# Altium project Space_Battery_Test.PrjPcb
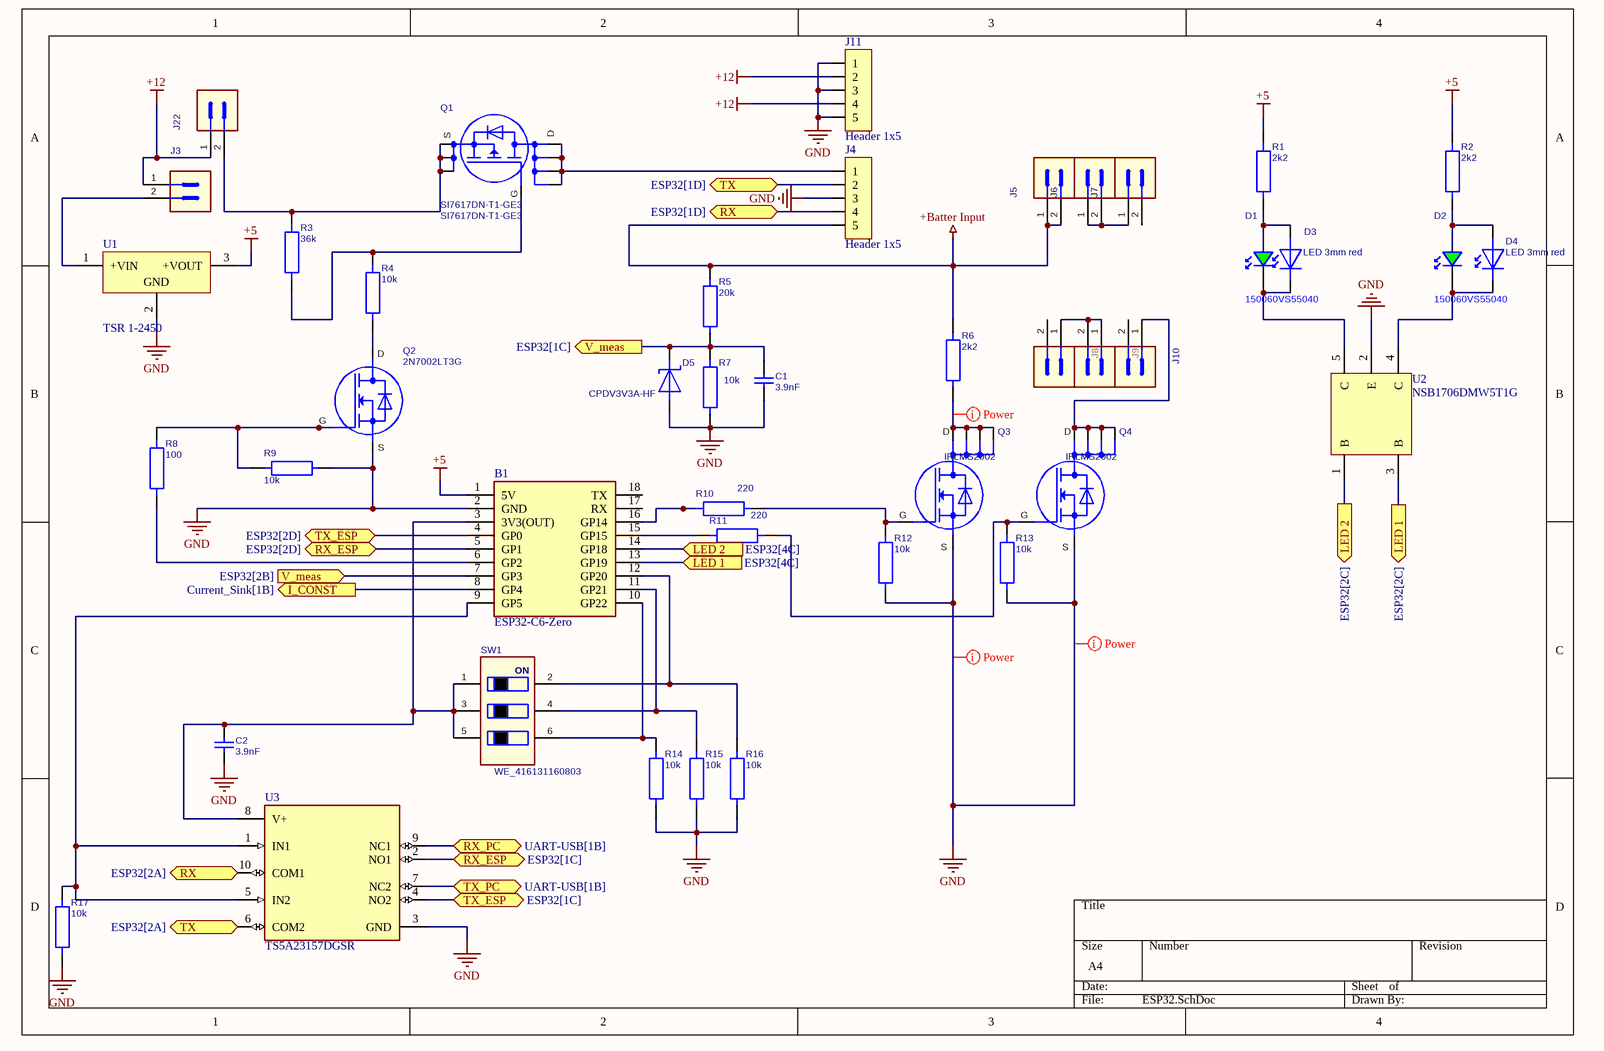
[diagram p0: ESP32.SchDoc, left]
3 sheets, 59 parts. Net scope: flat (ports and power ports of the same name join across sheets).
Board file: Space_Test_Battery.PcbDoc
Sheets:
  ESP32.SchDoc
  UART-USB.SchDoc
  Current_Sink.SchDoc

## Sheet ESP32.SchDoc
size A4; SheetNumber: 1; SheetTotal: 3

### Parts
B1  ESP32-C6-Zero  [ESP32C6Zero]
C1  3.9nF  [CAP0805H1520]
C2  3.9nF  [CAP0805H1520]
D1  150060VS55040  [LEDC160X75X41L40-green(WE)]
D2  150060VS55040  [LEDC160X75X41L40-green(WE)]
D3  LED 3mm red  [LED_THT_3mm]
D4  LED 3mm red  [LED_THT_3mm]
D5  CPDV3V3A-HF  [SOD882]
J3  5-825433-0_2/50  [PIN_HEADER_2_54mm_1_1mm_1x2]  (value not drawn)
J4  Header 1x5  [Header 1x5 2.54mm]
J5  5-825433-0_2/50  [PIN_HEADER_2_54mm_1_1mm_1x2]  (value not drawn)
J6  5-825433-0_2/50  [PIN_HEADER_2_54mm_1_1mm_1x2]  (value not drawn)
J7  5-825433-0_2/50  [PIN_HEADER_2_54mm_1_1mm_1x2]  (value not drawn)
J8  5-825433-0_2/50  [PIN_HEADER_2_54mm_1_1mm_1x2]  (value not drawn)
J9  5-825433-0_2/50  [PIN_HEADER_2_54mm_1_1mm_1x2]  (value not drawn)
J10  5-825433-0_2/50  [PIN_HEADER_2_54mm_1_1mm_1x2]  (value not drawn)
J11  Header 1x5  [Header 1x5 2.54mm]
J22  5-825433-0_2/50  [PIN_HEADER_2_54mm_1_1mm_1x2]  (value not drawn)
Q1  SI7617DN-T1-GE3  [PowerPAK1212-8]
Q2  2N7002LT3G  [SOT23]
Q3  IRLMS2002  [SOT23-6]
Q4  IRLMS2002  [SOT23-6]
R1  2k2  [RES0805MD]
R2  2k2  [RES0805MD]
R3  36k  [RES0805MD]
R4  10k  [RES0805MD]
R5  20k  [RES0805MD]
R6  2k2  [RES0805MD]
R7  10k  [RES0805MD]
R8  100  [RES0805MD]
R9  10k  [RES0805MD]
R10  220  [RES0805MD]
R11  220  [RES0805MD]
R12  10k  [RES0805MD]
R13  10k  [RES0805MD]
R14  10k  [RES0805MD]
R15  10k  [RES0805MD]
R16  10k  [RES0805MD]
R17  10k  [RES0805MD]
SW1  WE_416131160803  [WE_416131160803]
U1  TSR 1-2450  [TRACO-SIP-3_V]
U2  NSB1706DMW5T1G  [ONSC-SC70-5-419A-02_V]
U3  TS5A23157DGSR  [FP-DGS0010A-IPC_C]

### Ports
I_CONST (out, see Current_Sink[1B]), LED 1 (in, see ESP32[4C]), LED 1 (out, see ESP32[2C]), LED 2 (in, see ESP32[4C]), LED 2 (out, see ESP32[2C]), RX (bidir, see ESP32[1D]), RX (bidir, see ESP32[2A]), RX_ESP (bidir, see ESP32[1C]), RX_ESP (bidir, see ESP32[2D]), RX_PC (bidir, see UART-USB[1B]), TX (bidir, see ESP32[1D]), TX (bidir, see ESP32[2A]), TX_ESP (bidir, see ESP32[1C]), TX_ESP (bidir, see ESP32[2D]), TX_PC (bidir, see UART-USB[1B]), V_meas (in, see ESP32[2B]), V_meas (out, see ESP32[1C])

### Nets
+5: B1.1(5V) R1.2 R2.2 U1.3(+VOUT)
+12: J3.1 J11.2 J11.4 J22.1
+Batter Input: J4.5 J5.1 J5.2 R5.2 R6.1
GND: B1.2(GND) C1.1 C2.1 D5.2(A) J4.3 J11.1 J11.3 J11.5 Q2.2(S) Q3.4(S) Q4.4(S) R7.1 R9.1 R12.1 R13.1 R14.2 R15.2 R16.2 R17.2 U1.2(GND) U2.2(E) U3.3(GND)
NetB1_3: B1.3(3V3(OUT)) C2.2 SW1.1 SW1.3 SW1.5 U3.8(V+)
NetB1_4: B1.4(GP0) U3.4(NO2) ; port TX_ESP
NetB1_5: B1.5(GP1) U3.2(NO1) ; port RX_ESP
NetB1_6: B1.6(GP2) R8.1
NetB1_7: B1.7(GP3) C1.2 D5.1(K) R5.1 R7.2 ; port V_meas
NetB1_8: B1.8(GP4) ; port I_CONST
NetB1_9: B1.9(GP5) R17.1 U3.1(IN1) U3.5(IN2)
NetB1_10: B1.10(GP22) R14.1 SW1.6
NetB1_11: B1.11(GP21) R15.1 SW1.4
NetB1_12: B1.12(GP20) R16.1 SW1.2
NetB1_13: B1.13(GP19) U2.3(B) ; port LED 1
NetB1_14: B1.14(GP18) U2.1(B) ; port LED 2
NetB1_15: B1.15(GP15) R11.1
NetB1_16: B1.16(GP14) R10.1
NetD1_1: D1.1(K) D3.2(K) U2.5(C)
NetD1_2: D1.2(A) D3.1(A) R1.1
NetD2_1: D2.1(K) D4.2(K) U2.4(C)
NetD2_2: D2.2(A) D4.1(A) R2.1
NetJ3_2: J3.2 U1.1(+VIN)
NetJ4_1: J4.1 Q1.5(D) Q1.6(D) Q1.7(D) Q1.8(D)
NetJ4_2: J4.2 U3.6(COM2) ; port TX
NetJ4_4: J4.4 U3.10(COM1) ; port RX
NetJ6_1: J6.1 J6.2 J7.1
NetJ8_1: J8.1 J9.1 J9.2
NetJ10_1: J10.1 Q4.1(D) Q4.2(D) Q4.5(D) Q4.6(D)
NetJ12_1: U3.9(NC1) ; port RX_PC
NetJ13_1: U3.7(NC2) ; port TX_PC
NetJ22_2: J22.2 Q1.1(S) Q1.2(S) Q1.3(S) R3.2
NetQ1_4: Q1.4(G) R3.1 R4.1
NetQ2_1: Q2.1(G) R8.2 R9.2
NetQ2_3: Q2.3(D) R4.2
NetQ3_1: Q3.1(D) Q3.2(D) Q3.5(D) Q3.6(D) R6.2
NetQ3_3: Q3.3(G) R10.2 R12.2
NetQ4_3: Q4.3(G) R11.2 R13.2

Not connected (* = marked no-connect by the designer): B1 17(RX) 18(TX); J7 2; J8 2; J10 2

### Layout directives
net class Power: GND, NetQ3_1

### Notes on the sheet
- (in symbol UID-1051BDF3C131CE8C09EA) ON

### Library data of the parts
B1 = ESP32-C6-Zero: ESP32-C6 Mini Development Board, Based on ESP32-C6FH4, Dual Processors, 160MHz Running Frequency, 2.4GHz WiFi 6 & Bluetooth 5, ESP32 Development Board; Manufacturer_Name: Waveshare; Geometry.Height: 5.5mm; Manufacturer_Part_Number: ESP32-C6-Zero; Mouser Part Number: *; Mouser Price/Stock: *; Arrow Part Number: *; Arrow Price/Stock: *; Datasheet Link: https://www.waveshare.com/esp32-c6-zero.htm
C1 C2 = UID-1DC189D77836E3ADB330: CAP 3.9nF 5% C0G 50V; SAP-Partnumber: 35031280; Manufacturer Part Number: 08055A392JAT2A; Manufacturer: KYOCERA AVX; Compliance: RoHS2; Temperature - Rated: -55 °C to +125 °C; Reviewer: hoersede; Library Status: Production; uid: UID-1DC189D77836E3ADB330; partid: 60; Category: Ceramic; ComponentLink1Description: Datasheet; ComponentLink1URL: https://code.bbraun.io/BA-RD-EE/altium-partlib/raw/main/components/datasheets/35031280_SMD_KOND-KER_3,9NF_5Proz_50V_C0G_0805/AVX_datasheet_C0GNP0-Dielectric.pdf; ComponentLink2Description: Compliance Certificate; ComponentLink2URL: https://code.bbraun.io/BA-RD-EE/altium-partlib/raw/main/components/datasheets/35031280_SMD_KOND-KER_3,9NF_5Proz_50V_C0G_0805/AVX_datasheet_C0GNP0-Dielectric.pdf; ComponentLink3Description: Datasheet Folder; ComponentLink3URL: https://code.bbraun.io/BA-RD-EE/altium-partlib/raw/main/components/datasheets/35031280_SMD_KOND-KER_3,9NF_5Proz_50V_C0G_0805/; ComponentLink4Description: Data Sheet Library; ComponentLink4URL: http://ais.development.bbraun.com/dsl/35031280; Supplier 1: Mouser; Supplier 2: Digikey; Supplier 3: RS Components; Supplier 4: Farnell; Value: 3.9nF; Tolerance: 5%; Maximum Height: 1.52 mm; Package / Case: 0805; Technology: SMT; Type: C0G; Price@1k: 0,01183 €; Voltage - Rated: 50V; Creator: weirmade; Creation Date: 22.05.2023; Last Updated: 22.05.2023; Review Date: 07.06.2025; Lifecycle Status: Active
D1 D2 = UID-108CCBCADD5F52F6FAD1: Led Green 0603 SMD; SAP-Partnumber: 35146000; Manufacturer: Würth Elektronik; Compliance: RoHS; Current Rated: 20mA; Voltage - Rated: 2.4V; Temperature - Rated: -40 °C to +85 °C; Remark: NGX; Reviewer: hoersede; Library Status: Prototype; uid: UID-108CCBCADD5F52F6FAD1; partid: 61; Category: LED; Manufacturer Part Number: 150060VS55040; ComponentLink1Description: Datasheet; ComponentLink1URL: https://code.bbraun.io/BA-RD-EE/altium-partlib/raw/main/components/datasheets/35146000_SMD_LED-Green_0603/35146000_Wuerth_150060VS55040_Datasheet.pdf; ComponentLink2Description: Compliance Certificate; ComponentLink2URL: https://code.bbraun.io/BA-RD-EE/altium-partlib/raw/main/components/datasheets/35146000_SMD_LED-Green_0603/35146000_Wuerth_150060VS55040_ROHS_REACH.pdf; ComponentLink3Description: Datasheet Folder; ComponentLink3URL: https://code.bbraun.io/BA-RD-EE/altium-partlib/raw/main/components/datasheets/35146000_SMD_LED-Green_0603/; ComponentLink4Description: Data Sheet Library; ComponentLink4URL: http://ais.development.bbraun.com/dsl/35146000; Supplier Part Number 1: 710-150060VS55040; Supplier Part Number 2: 732-12017-2-ND; Supplier Part Number 3: 1766157; Supplier Part Number 4: 2900765RL; Supplier 1: Mouser; Supplier 2: Digikey; Supplier 3: RS Components; Supplier 4: Farnell; Maximum Height: 0.5 mm; Package / Case: 0603; Technology: SMT; Price@1k: 0,033 €; Creator: GEG DF,GK; Creation Date: 21.05.2022; Last Updated: 15.01.2026; Review Date: 08.06.2025; Lifecycle Status: Active
D3 D4 = UID-E12BBC48C07D2EA352E9: LED Red, 625 nm, GaAsP/GaP, THT, 3mm; Manufacturer Part Number: TC-9510472; Manufacturer: TruComponents; Current Rated: 20 mA; Voltage - Rated: 5V; Temperature - Rated: -40 °C to + 85 °C; Remark: EPG; Library Status: New; uid: UID-E12BBC48C07D2EA352E9; partid: 106; Category: LED; ComponentLink1Description: Datasheet; ComponentLink1URL: https://code.bbraun.io/BA-RD-EE/altium-partlib/raw/main/components/datasheets/UID-E12BBC48C07D2EA352E9_LED_3mm_Red_THT/3mm_LED_Datasheet.pdf; ComponentLink2Description: Compliance Certificate; ComponentLink3Description: Datasheet Folder; ComponentLink3URL: https://code.bbraun.io/BA-RD-EE/altium-partlib/raw/main/components/datasheets/UID-E12BBC48C07D2EA352E9_LED_3mm_Red_THT/; ComponentLink4Description: Data Sheet Library; Supplier Part Number 1: 2377618 - 62; Supplier 1: Conrad; Supplier 2: Digikey; Supplier 3: RS Components; Supplier 4: Farnell; Maximum Height: 6.3 mm; Package / Case: 3mm; Technology: THT; Price@1k: 0,18 €; BBPUC-Partnumber: -; Creator: palmfrde; Creation Date: 22.04.2026; Lifecycle Status: Active
D5 = UID-3D03554C99A7E31313F8: Unidirectional ESD protection diode; SAP-Partnumber: 35140169; Manufacturer Part Number: PESD3V3S1UL; Manufacturer: Nexperia; BBPUC-Partnumber: 2838.332; Compliance: RoHS2; Current Rated: 15A; Voltage - Rated: 3.3V; Temperature - Rated: -55 °C to +150 °C; Reviewer: hoersede; Library Status: Prototype; uid: UID-3D03554C99A7E31313F8; partid: 43; Category: ESD Diode; ComponentLink1Description: Datasheet; ComponentLink1URL: https://code.bbraun.io/BA-RD-EE/altium-partlib/raw/main/components/datasheets/35140169_SMD_Diode_ESD_PESD3V3S1UL_SOD882/PESD3V3S1UL.pdf; ComponentLink2Description: Compliance Certificate; ComponentLink2URL: https://code.bbraun.io/BA-RD-EE/altium-partlib/raw/main/components/datasheets/35140169_SMD_Diode_ESD_PESD3V3S1UL_SOD882/Nexperia_-_Statement_on_RoHS_082019.pdf; ComponentLink3Description: Datasheet Folder; ComponentLink3URL: https://code.bbraun.io/BA-RD-EE/altium-partlib/raw/main/components/datasheets/35140169_SMD_Diode_ESD_PESD3V3S1UL_SOD882/; ComponentLink4Description: Data Sheet Library; ComponentLink4URL: http://ais.development.bbraun.com/dsl/35140169; Supplier 1: Mouser; Supplier 2: Digikey; Supplier 3: RS Components; Supplier 4: Farnell; Maximum Height: 0.5 mm; Package / Case: SOD882; Price@1k: 0,0247 €; Creator: hoersede; Creation Date: 16.05.2023; Last Updated: 22.06.2023; Review Date: 08.06.2025; Lifecycle Status: Active
J3 J5-J10 J22 = UID-C948C1FBE4D127CA7C47: THT Pin Header, 1x2, 2.54mm, stehend; SAP-Partnumber: 33193339; Manufacturer: TE Connectivity; Compliance: RoHS2; Contacts: 2; Current Rated: 5A; Voltage - Rated: 750Vrms; Temperature - Rated: -65 °C to + 105 °C; Reviewer: vaupmide; Library Status: Prototype; uid: UID-C948C1FBE4D127CA7C47; partid: 27; Category: Pin Header; Manufacturer Part Number: 5-825433-0; ComponentLink1Description: Datasheet; ComponentLink1URL: https://code.bbraun.io/BA-RD-EE/altium-partlib/raw/main/components/datasheets/33193339_PIN_HEADER_2_54mm_1x50_TE/product-5-825433-0.datasheet.pdf; ComponentLink2Description: Compliance Certificate; ComponentLink2URL: https://code.bbraun.io/BA-RD-EE/altium-partlib/raw/main/components/datasheets/33193339_PIN_HEADER_2_54mm_1x50_TE/product-5-825433-0.datasheet.pdf; ComponentLink3Description: Datasheet Folder; ComponentLink3URL: https://code.bbraun.io/BA-RD-EE/altium-partlib/raw/main/components/datasheets/33193339_PIN_HEADER_2_54mm_1x50_TE; ComponentLink4Description: Data Sheet Library; ComponentLink4URL: http://ais.development.bbraun.com/dsl/33193339; Supplier 1: Mouser; Supplier 2: Digikey; Supplier 3: RS Components; Supplier 4: Farnell; Maximum Height: 8.54 mm; Price@1k: 1,65 €; Creator: sifngu01; Creation Date: 09.02.2023; Last Updated: 22.06.2023; Review Date: 12.06.2024; Lifecycle Status: Active
J4 J11 = CMP-002-00275-1: Header 1x5 2.54mm; Design Item ID: Header 1x5; Source: Header.SchLib
Q1 = UID-FE97C754B092DB379145: FET P-CH; SAP-Partnumber: 35140024; Manufacturer: Vishay; Compliance: RoHS3; Current - Rated: 35 A; Voltage - Rated: 30V; Temperature - Rated: -55 °C to +150 °C; RDS-on: 0.0123R; Reviewer: vaupmide; Library Status: Prototype; Manufacturer Part Number: SI7617DN-T1-GE3; uid: UID-FE97C754B092DB379145; partid: 22; Category: FET p-Ch; ComponentLink1Description: Datasheet; ComponentLink1URL: https://code.bbraun.io/BA-RD-EE/altium-partlib/raw/main/components/datasheets/35140024_SMD_Transistor_P-Channel_Si7617DN/Datasheet_SI7617DN.pdf; ComponentLink2Description: Compliance Certificate; ComponentLink2URL: https://code.bbraun.io/BA-RD-EE/altium-partlib/raw/main/components/datasheets/35140024_SMD_Transistor_P-Channel_Si7617DN/Compliance/VISH-E-A0015053004-1.pdf; ComponentLink3Description: Datasheet Folder; ComponentLink3URL: https://code.bbraun.io/BA-RD-EE/altium-partlib/raw/main/components/datasheets/35140024_SMD_Transistor_P-Channel_Si7617DN/; ComponentLink4Description: Data Sheet Library; ComponentLink4URL: http://ais.development.bbraun.com/dsl/35140024; Supplier 1: Mouser; Supplier 2: Digikey; Supplier 3: RS Components; Supplier 4: Farnell; Supplier Part Number 1: 781-SI7617DN-GE3; Supplier Part Number 2: SI7617DN-T1-GE3TR-ND; Maximum Height: 1.17 mm; Package / Case: PowerPAK1212-8; Technology: SMT; Price@1k: 0,2450 €; Creator: mochalde; Creation Date: 04.08.2023; Last Updated: 28.11.2023; Review Date: 08.07.2024; Lifecycle Status: Active
Q2 = UID-746324AF67844B7863CB: N-Channel MOSFET 60V 115m, SMD SOT23-3; SAP-Partnumber: 35140038; Manufacturer: onsemi; Compliance: RoHS; Current - Rated: 115 mA; Temperature - Rated: -55 °C to +150 °C; RDS-on: 7R5; Remark: NGX; Reviewer: vaupmide; Library Status: Prototype; uid: UID-746324AF67844B7863CB; partid: 17; Category: FET n-Ch; Manufacturer Part Number: 2N7002LT3G; ComponentLink1Description: Datasheet; ComponentLink1URL: https://code.bbraun.io/BA-RD-EE/altium-partlib/raw/main/components/datasheets/35140038_SMD_MOSFET-N-Chanel_2N7002L_SOT23/Onsemi_2N7002LT3G.PDF; ComponentLink2Description: Compliance Certificate; ComponentLink2URL: https://code.bbraun.io/BA-RD-EE/altium-partlib/raw/main/components/datasheets/35140038_SMD_MOSFET-N-Chanel_2N7002L_SOT23/Compliance/RoHS-Compliance_2N7002LT3G.png; ComponentLink3Description: Datasheet Folder; ComponentLink3URL: https://code.bbraun.io/BA-RD-EE/altium-partlib/raw/main/components/datasheets/35140038_SMD_MOSFET-N-Chanel_2N7002L_SOT23/; ComponentLink4Description: Data Sheet Library; ComponentLink4URL: http://ais.development.bbraun.com/dsl/35140038; Supplier 1: Mouser; Supplier 2: Digikey; Supplier 3: RS Components; Supplier 4: Farnell; Supplier Part Number 1: 863-2N7002LT3G; Supplier Part Number 2: 2N7002LT3GOSTR-ND; Maximum Height: 1.1 mm; Package / Case: SOT-23; Technology: SMT; Price@1k: 0,235 €; Voltage - Rated: 60V; Creator: GEG DF,GK; Creation Date: 22.04.2022; Last Updated: 10.01.2024; Review Date: 08.07.2024; Lifecycle Status: Active
Q3 Q4 = UID-A18DAACDD2725A595700: FET N-Ch; SAP-Partnumber: 35140704; Manufacturer Part Number: IRLMS2002TRPBF; Manufacturer: Infineon; Compliance: RoHS2; Current Rated: 6.5A; Voltage - Rated: 20V; Temperature - Rated: -55 °C to +150 °C; RDS-on: 0.03R; Reviewer: hoersede; Library Status: Production; uid: UID-A18DAACDD2725A595700; partid: 7; Category: FET n-Ch; ComponentLink1Description: Datasheet; ComponentLink1URL: https://code.bbraun.io/BA-RD-EE/altium-partlib/raw/main/components/datasheets/35140704_SMD_TRANSISTOR_N-KANAL_IRLMS2002_SOT-23/Infineon_datasheet_IRLMS2002-v01_01.pdf; ComponentLink2Description: Compliance Certificate; ComponentLink2URL: https://code.bbraun.io/BA-RD-EE/altium-partlib/raw/main/components/datasheets/35140704_SMD_TRANSISTOR_N-KANAL_IRLMS2002_SOT-23/Infineon_datasheet_IRLMS2002-v01_01.pdf; ComponentLink3Description: Datasheet Folder; ComponentLink3URL: https://code.bbraun.io/BA-RD-EE/altium-partlib/raw/main/components/datasheets/35140704_SMD_TRANSISTOR_N-KANAL_IRLMS2002_SOT-23/; ComponentLink4Description: Data Sheet Library; ComponentLink4URL: http://ais.development.bbraun.com/dsl/35140704; Supplier 1: Mouser; Supplier 2: Digikey; Supplier 3: RS Components; Supplier 4: Farnell; Maximum Height: 1.45 mm; Package / Case: SOT23; Price@1k: 0,0751 €; Creator: weirmade; Creation Date: 18.08.2022; Review Date: 07.06.2025; Lifecycle Status: Active
R1-R17 = UID-0F2DF2513351442B7CD8: RES 2K2 1% 125mW 0805; SAP-Partnumber: 35110490; Manufacturer Part Number: RC0805FR-132K2L; Manufacturer: Yageo; Compliance: RoHS; Voltage - Rated: 150V; Temperature Coefficient: TC100; Temperature - Rated: -55 °C to +155 °C; Remark: NGX; Reviewer: hoersede; Library Status: New; uid: UID-0F2DF2513351442B7CD8; partid: 156; ComponentLink1Description: Datasheet; ComponentLink1URL: https://code.bbraun.io/BA-RD-EE/altium-partlib/raw/main/components/datasheets/35110490_SMD_Widerstand_2K2_1Proz_0805/Yageo_RC0805FR-132K2L.pdf; ComponentLink2Description: Compliance Certificate; ComponentLink2URL: https://code.bbraun.io/BA-RD-EE/altium-partlib/raw/main/components/datasheets/35110490_SMD_Widerstand_2K2_1Proz_0805/Yageo_RC0805FR-132K2L.pdf; ComponentLink3Description: Datasheet Folder; ComponentLink3URL: https://code.bbraun.io/BA-RD-EE/altium-partlib/raw/main/components/datasheets/35110490_SMD_Widerstand_2K2_1Proz_0805/; ComponentLink4Description: Data Sheet Library; ComponentLink4URL: http://ais.development.bbraun.com/dsl/35110490; Supplier Part Number 1: 603-RC0805FR-132K2L; Supplier Part Number 2: 13-RC0805FR-132K2LTR-ND; Supplier 1: Mouser; Supplier 2: Digikey; Supplier 3: RS Components; Supplier 4: Farnell; Value: 2k2; Tolerance: 1%; Maximum Height: 0.6 mm; Package / Case: 0805; Technology: SMT; Type: Thick Film; Price@1k: 0,0075 €; Power - Rated: 125mW; Creator: GEG DF,GK; Creation Date: 22.04.2022; Last Updated: 22.06.2023; Review Date: 10.03.2026; Lifecycle Status: Active
SW1 = UID-1051BDF3C131CE8C09EA: SMD DIP-Switch tripple 1.27mm pitch; Manufacturer: Würth Elektronik; Compliance: RoHS; Temperature - Rated: -40 °C to +85 °C; uid: UID-1051BDF3C131CE8C09EA; partid: 30; Category: DIP Switch; Manufacturer Part Number: 416131160803; ComponentLink1Description: Datasheet; ComponentLink1URL: https://code.bbraun.io/BA-RD-EE/altium-partlib/raw/main/components/datasheets/UID-1051BDF3C131CE8C09EA_DIP-Switch_Wuerth_416131160803/Wuerth_416131160803.pdf; ComponentLink2Description: Compliance Certificate; ComponentLink2URL: https://code.bbraun.io/BA-RD-EE/altium-partlib/raw/main/components/datasheets/UID-1051BDF3C131CE8C09EA_DIP-Switch_Wuerth_416131160803/Wuerth_416131160803.pdf; ComponentLink3Description: Datasheet Folder; ComponentLink3URL: https://code.bbraun.io/BA-RD-EE/altium-partlib/raw/main/components/datasheets/UID-1051BDF3C131CE8C09EA_DIP-Switch_Wuerth_416131160803/; ComponentLink4Description: Data Sheet Library; Supplier Part Number 1: 710-416131160803; Supplier Part Number 2: 732-416131160803TR-ND; Supplier Part Number 3: 254-1753; Supplier 1: Mouser; Supplier 2: Digikey; Supplier 3: RS Components; Supplier 4: Farnell; Maximum Height: 2.65 mm; Technology: SMT; Price@1k: 1,76 €; Creator: ostemcde; Creation Date: 11.02.2025
U1 = CMP-2000-05427-1: DC/DC converter, 5 VDC, 1000 mA, -40 to 85 degC, 3-Pin SIP, RoHS; Manufacturer: Tracopower; Output Voltage Nom.: 5V; Output Current Max: 1A; Product Range: TSR-1Series; DC / DC Converter Mounting: ThroughHole; Output Power Max: 5W; No. of Outputs: 1Output; Input Voltage DC Max: 36V; Approvals & Standards: IEC,UL; Input Voltage DC Min: 6.5V; DC / DC Converter Output Type: Fixed; Depth: 11.7mm; Package Reference: SIP-3; DC / DC Converter Type: SIP; Height: 10.2mm; Width: 7.6mm; Package Description: 3-Pin Single In-line Package, Body 11.7 x 7.6 mm, Pitch 2.54 mm; Manufacturer URL: http://www.tracopower.com/home; Datasheet Version: Jan-15; Datasheet URL: https://datasheet.ciiva.com/6815/tsr1-6815641.pdf
U2 = CMP-0630-00174-1: Dual Bias Resistor Transistors, NPN Silicon Surface Mount Transistor, 5-Pin SC70, Pb-Free, Tape and Reel; Manufacturer: On Semiconductor; Polarity: Dual NPN; V(BR)CEO Min (V): 50; hFE Min: 80; IC Continuous (A): 0.1; ComponentLink2URL: http://www.onsemi.cn/pub_link/Collateral/NSB1706DMW5T1-D.PDF; RoHS: TRUE; Mounting Technology: Surface Mount; PackageReference: SC70-5-419A-02; PackageVersion: Rev. L, 01/2013; ComponentLink2Description: Datasheet; DatasheetVersion: Rev. 5; ComponentLink1Description: Manufacturer URL; ComponentLink3Description: Package Specification; R1/R2 Typ: 0.1; PackageDescription: 5-Pin Small Outline Transistor, Body 2 x 1.25 mm, Pitch 0.65 mm; Packing: Tape and Reel; ComponentLink3URL: http://www.onsemi.cn/pub_link/Collateral/419A-02.PDF; ComponentLink1URL: http://www.onsemi.com/; PartNumber: NSB1706DMW5T1G
U3 = CMP-04892-000058-1: IC SWITCH DUAL SPDT 10MSOP; On-State Resistance: 10R; Min Supply Voltage: 1.8V; Max Supply Voltage: 5.5V; Turn-On Delay Time: 5.7ns; Number of Inputs: 2; Operating Supply Current: 1uA; Supply Type: Single; High Level Output Current: 50mA; Turn-Off Delay Time: 3.8ns; Number of Outputs: 4; Bandwidth: 220MHz; Polarity: Non-Inverting; Height: 1.02mm; Contact Plating: Gold; Number of Pins: 10; Length: 3mm; Series: -; Packaging: Tape and Reel; Case/Package: VSSOP; Radiation Hardening: No; Width: 3mm; Number of Channels: 2; Max Operating Temperature: 85°C; Lead Free: Lead Free; Weight: 0.000663oz; Package Quantity: 1; Number of Bits: 2; Low Level Output Current: 50mA; Max Supply Current: 1uA; Throw Configuration: SPDT; Min Operating Temperature: -40°C; Mount: Surface Mount

## Sheet UART-USB.SchDoc
size A4; SheetNumber: 2; SheetTotal: 3
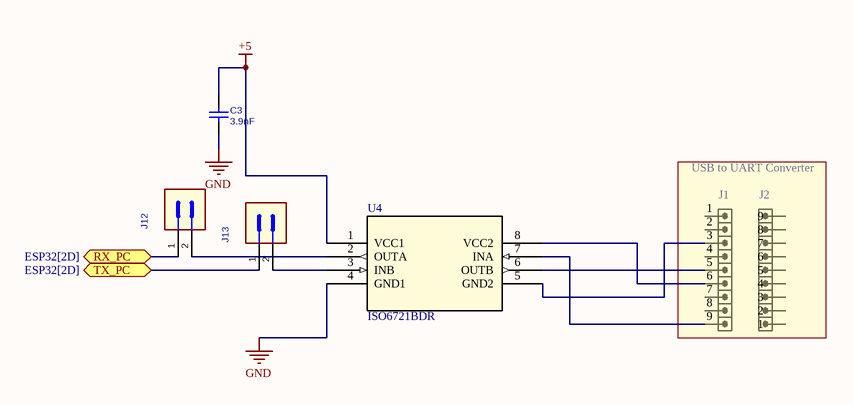
[diagram p1: UART-USB.SchDoc]

### Parts
C3  3.9nF  [CAP0805H1520]
J1  HDR_M_1X9  [HDR_M_1X9]  (value not drawn)
J2  HDR_M_1X9  [HDR_M_1X9]  (value not drawn)
J12  5-825433-0_2/50  [PIN_HEADER_2_54mm_1_1mm_1x2]  (value not drawn)
J13  5-825433-0_2/50  [PIN_HEADER_2_54mm_1_1mm_1x2]  (value not drawn)
U4  ISO6721BDR  [SOIC_1BDR_TEX]

### Blocks framed on the sheet
USB to UART Converter: J1 J2

### Ports
RX_PC (bidir, see ESP32[2D]), TX_PC (bidir, see ESP32[2D])

### Nets
+5: C3.2 U4.1(VCC1)
GND: C3.1 U4.4(GND1)
NetJ1_3: J1.3 U4.5(GND2)
NetJ1_5: J1.5 U4.6(OUTB)
NetJ1_6: J1.6 U4.8(VCC2)
NetJ1_9: J1.9 U4.7(INA)
NetJ12_1: J12.1 ; port RX_PC
NetJ12_2: J12.2 U4.2(OUTA)
NetJ13_1: J13.1 ; port TX_PC
NetJ13_2: J13.2 U4.3(INB)

Not connected (* = marked no-connect by the designer): J1 1 2 4 7 8; J2 1 2 3 4 5 6 7 8 9

### Library data of the parts
C3 = UID-1DC189D77836E3ADB330: as C1 on sheet ESP32; uid: UID-1DC189D77836E3ADB330; partid: 60; Category: Ceramic; ComponentLink1Description: Datasheet; ComponentLink1URL: https://code.bbraun.io/BA-RD-EE/altium-partlib/raw/main/components/datasheets/35031280_SMD_KOND-KER_3,9NF_5Proz_50V_C0G_0805/AVX_datasheet_C0GNP0-Dielectric.pdf; ComponentLink2Description: Compliance Certificate; ComponentLink2URL: https://code.bbraun.io/BA-RD-EE/altium-partlib/raw/main/components/datasheets/35031280_SMD_KOND-KER_3,9NF_5Proz_50V_C0G_0805/AVX_datasheet_C0GNP0-Dielectric.pdf; ComponentLink3Description: Datasheet Folder; ComponentLink3URL: https://code.bbraun.io/BA-RD-EE/altium-partlib/raw/main/components/datasheets/35031280_SMD_KOND-KER_3,9NF_5Proz_50V_C0G_0805/; ComponentLink4Description: Data Sheet Library; ComponentLink4URL: http://ais.development.bbraun.com/dsl/35031280; Supplier 1: Mouser; Supplier 2: Digikey; Supplier 3: RS Components; Supplier 4: Farnell; Value: 3.9nF; Tolerance: 5%; Maximum Height: 1.52 mm; Package / Case: 0805; Technology: SMT; Type: C0G; Price@1k: 0,01183 €; Voltage - Rated: 50V; Creator: weirmade; Creation Date: 22.05.2023; Last Updated: 22.05.2023; Review Date: 07.06.2025; Lifecycle Status: Active
J1 J2 = CMP-002-00798-1: VALUE: HDRM9; Component Type: Standard; Pins: 9; Design Item ID: HDR_M_1X9; Source: Conn Header.SchLib
J12 J13 = UID-C948C1FBE4D127CA7C47: as J3 on sheet ESP32; uid: UID-C948C1FBE4D127CA7C47; partid: 27; Category: Pin Header; Manufacturer Part Number: 5-825433-0; ComponentLink1Description: Datasheet; ComponentLink1URL: https://code.bbraun.io/BA-RD-EE/altium-partlib/raw/main/components/datasheets/33193339_PIN_HEADER_2_54mm_1x50_TE/product-5-825433-0.datasheet.pdf; ComponentLink2Description: Compliance Certificate; ComponentLink2URL: https://code.bbraun.io/BA-RD-EE/altium-partlib/raw/main/components/datasheets/33193339_PIN_HEADER_2_54mm_1x50_TE/product-5-825433-0.datasheet.pdf; ComponentLink3Description: Datasheet Folder; ComponentLink3URL: https://code.bbraun.io/BA-RD-EE/altium-partlib/raw/main/components/datasheets/33193339_PIN_HEADER_2_54mm_1x50_TE; ComponentLink4Description: Data Sheet Library; ComponentLink4URL: http://ais.development.bbraun.com/dsl/33193339; Supplier 1: Mouser; Supplier 2: Digikey; Supplier 3: RS Components; Supplier 4: Farnell; Maximum Height: 8.54 mm; Price@1k: 1,65 €; Creator: sifngu01; Creation Date: 09.02.2023; Last Updated: 22.06.2023; Review Date: 12.06.2024; Lifecycle Status: Active
U4 = CMP-7264-000000-1: General-purpose, dual-channel, 1/1 digital isolator 8-SOIC -40 to 125; Manufacturer_Name: Texas Instruments; Copyright: Copyright (C) 2025 Ultra Librarian. All rights reserved.; Design Item ID: ISO6721BDR; Type: Type; Component Type: Standard; RefDes: RefDes; Source: ISO6721BDR.SchLib; Manufacturer_Part_Number: ISO6721BDR; Pin Count: 8

## Sheet Current_Sink.SchDoc
size A4; SheetNumber: 3; SheetTotal: 3
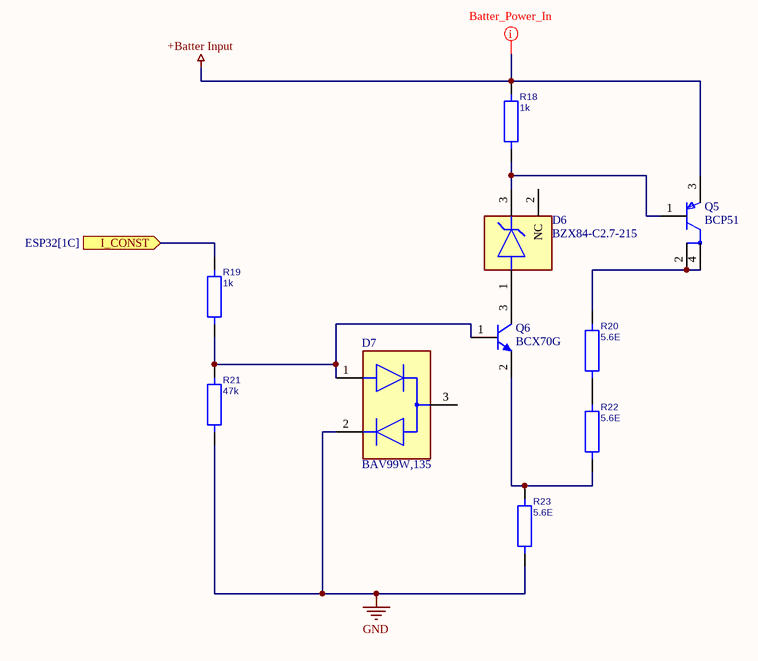
[diagram p2: Current_Sink.SchDoc]

### Parts
D6  BZX84-C2.7-215  [FP-SOT23-MFG]
D7  BAV99W,135  [FP-SOT323-IPC_B]
Q5  BCP51  [FP-318H-MFG]
Q6  BCX70G  [INF-SOT23_N]
R18  1k  [RES0805MD]
R19  1k  [RES0805MD]
R20  5.6E  [RES0805MD]
R21  47k  [RES0805MD]
R22  5.6E  [RES0805MD]
R23  5.6E  [RES0805MD]

### Ports
I_CONST (in, see ESP32[1C])

### Nets
+Batter Input: Q5.3(E) R18.2
GND: D7.2 R21.1 R23.1
NetB1_8: R19.2 ; port I_CONST
NetD6_1: D6.1(A) Q6.3(C)
NetD6_3: D6.3(K) Q5.1(B) R18.1
NetD7_1: D7.1 Q6.1(B) R19.1 R21.2
NetQ5_2: Q5.2(C) Q5.4(C) R20.2
NetQ6_2: Q6.2(E) R22.1 R23.2
NetR20_1: R20.1 R22.2

Not connected (* = marked no-connect by the designer): D6 2(NC); D7 3

### Layout directives
net class Batter_Power_In: +Batter Input

### Library data of the parts
D6 = CMP-14400-000001-1: DIODE ZENER 2,7V 250MW SOT23; Manufacturer: Nexperia; Manufacturer Part Number: BZX84-C20,215; Automotive Grade: Grade 0; Zener Impedance: 15Ω; Max Junction Temp: +150°C; Max Zener Voltage: 21.2V; Nom Zener Voltage: 20V; Max Reverse Leakage Current: 0.05uA; Forward Current: 200mA; Reverse Voltage: 14V; Device Class L2: Diodes; ComponentLink2Description: Datasheet; Temperature Range Low: -65°C; Height: 1.1mm; Ipc Land Pattern Name: SOT95P230X100-3; Octopart: https://octopart.com/bzx84-c20%2C215-nexperia-78740231; ComponentLink2URL: https://assets.nexperia.com/documents/data-sheet/BZX84_SER.pdf; Footprint Url: https://assets.nexperia.com/documents/outline-drawing/SOT23.pdf; Power Dissipation: 250mW; RoHS: TRUE; Lead Free: Yes; Mouser Description: Diode Zener Single 20V 5% 250mW Automotive 3-Pin SOT-23 T/R; Automotive: Yes; Device Class L1: Discrete Semiconductors; Temperature: -65°C to +150°C; Package: SOT23; Category: Diode; Digikey Description: DIODE ZENER 20V 250MW SOT23; Ambient Temperature Range High: +150°C; Temperature Range High: +150°C; Device Class L3: Zener Diodes
D7 = CMP-14399-000011-1: DIODE ARRAY GP 100V 150MA SOT323
Q5 = CMP-00278-84324633-1: BCP51 Trans Gp Bjt PNP 45V 1.5A 1000MW 4-PIN(3+TAB) SOT-223 T/r / Trans PNP 45V 1.5A SOT-223; Manufacturer Lifecycle Status: OBSOLETE; Collector Emitter Breakdown Voltage: -45V; Collector Emitter Saturation Voltage: -500mV; Power Dissipation: 1W; Max Collector Current: -1.5A; hFE Min: 40; Number of Elements: 1; Max Junction Temperature (Tj): 150°C; Emitter Base Voltage (VEBO): -5V; Number of Pins: 3; RoHS: Compliant; Collector Base Voltage (VCBO): -45V; NexarPartId: 84324633; Polarity: PNP; Collector Emitter Voltage (VCEO): -45V; Schedule B: 8541290080, 8541290080; Lead Free: Lead Free; Lifecycle Status: Obsolete; Height: 1.8mm; Case/Package: SOT-223; Max Operating Temperature: 150°C; Min Operating Temperature: -55°C
Q6 = CMP-1177-00052-1: NPN Silicon AF Transistor, 45 V VCEO, 100 mA IC, SOT23, Reel, Green; Manufacturer: Infineon; ICM (max): 200Â mA; ICBO (max): 20Â nA; Green: TRUE; fT (typ): 250Â MHz; IC (max): 100Â mA; VCEO (max): 45Â V; Ptot (max): 330Â mW; VEBO (max): 6Â V; F (typ): 2 dB; PackageDescription: 3-Pin Small Outline Transistor Package, 1.3 x 2.9 mm Body, 0.95 mm Pitch; Packing: Reel; Polarity: NPN; ComponentLink3URL: http://www.infineon.com/dgdl/SOT23-Package_Overview.pdf?folderId=db3a30431936bc4b0119532290053c66&fileId=db3a30431936bc4b0119533468123c85; ComponentLink2Description: Datasheet; ComponentLink1URL: http://www.infineon.com/; Mounting Technology: Surface Mount; PackageReference: SOT23; ComponentLink2URL: http://www.infineon.com/dgdl/bcw60_bcx70.pdf?folderId=db3a304314dca389011541d30fa21656&fileId=db3a304314dca38901154219c9141726; ComponentLink1Description: Manufacturer URL; VCBO (max): 45Â V; ComponentLink3Description: Package Specification; PartNumber: BCX70G; IBM (max): 200Â mA; PackageVersion: Apr-08
R18-R23 = UID-0F2DF2513351442B7CD8: as R1 on sheet ESP32; uid: UID-0F2DF2513351442B7CD8; partid: 156; ComponentLink1Description: Datasheet; ComponentLink1URL: https://code.bbraun.io/BA-RD-EE/altium-partlib/raw/main/components/datasheets/35110490_SMD_Widerstand_2K2_1Proz_0805/Yageo_RC0805FR-132K2L.pdf; ComponentLink2Description: Compliance Certificate; ComponentLink2URL: https://code.bbraun.io/BA-RD-EE/altium-partlib/raw/main/components/datasheets/35110490_SMD_Widerstand_2K2_1Proz_0805/Yageo_RC0805FR-132K2L.pdf; ComponentLink3Description: Datasheet Folder; ComponentLink3URL: https://code.bbraun.io/BA-RD-EE/altium-partlib/raw/main/components/datasheets/35110490_SMD_Widerstand_2K2_1Proz_0805/; ComponentLink4Description: Data Sheet Library; ComponentLink4URL: http://ais.development.bbraun.com/dsl/35110490; Supplier Part Number 1: 603-RC0805FR-132K2L; Supplier Part Number 2: 13-RC0805FR-132K2LTR-ND; Supplier 1: Mouser; Supplier 2: Digikey; Supplier 3: RS Components; Supplier 4: Farnell; Value: 2k2; Tolerance: 1%; Maximum Height: 0.6 mm; Package / Case: 0805; Technology: SMT; Type: Thick Film; Price@1k: 0,0075 €; Power - Rated: 125mW; Creator: GEG DF,GK; Creation Date: 22.04.2022; Last Updated: 22.06.2023; Review Date: 10.03.2026; Lifecycle Status: Active

## Nets that join several sheets
+5: ESP32 (B1.1 R1.2 R2.2 U1.3), UART-USB (C3.2 U4.1)
+Batter Input: ESP32 (5 pins), Current_Sink (Q5.3 R18.2)
GND: ESP32 (22 pins), UART-USB (C3.1 U4.4), Current_Sink (D7.2 R21.1 R23.1)
NetB1_8: ESP32 (B1.8), Current_Sink (R19.2)
NetJ12_1: ESP32 (U3.9), UART-USB (J12.1)
NetJ13_1: ESP32 (U3.7), UART-USB (J13.1)